# Altium schematic sheet 1_MAIN.SchDoc
size A4; SheetNumber: 1; SheetTotal: 2
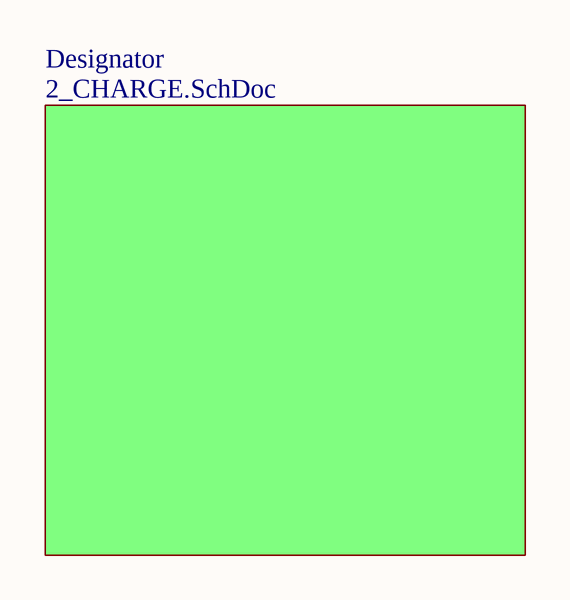
[diagram p0: 1_MAIN.SchDoc]

## Sub-sheets
Designator = 2_CHARGE.SchDoc: no entries